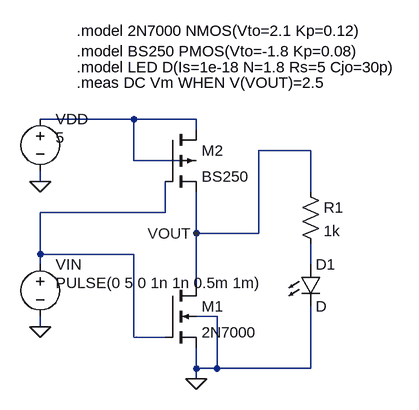
[diagram p0: schematic SPICE SCHEMATIC.asc]
SPICE SCHEMATIC.asc, the LTspice schematic file:
Version 4.1
SHEET 1 948 680
WIRE 160 -336 16 -336
WIRE 256 -336 160 -336
WIRE 256 -320 256 -336
WIRE 432 -288 352 -288
WIRE 160 -272 160 -336
WIRE 256 -272 160 -272
WIRE 16 -240 16 -256
WIRE 432 -224 432 -288
WIRE 208 -192 208 -240
WIRE 208 -192 16 -192
WIRE 256 -160 256 -224
WIRE 352 -160 352 -288
WIRE 352 -160 256 -160
WIRE 16 -128 16 -192
WIRE 160 -128 16 -128
WIRE 16 -112 16 -128
WIRE 432 -112 432 -144
WIRE 256 -80 256 -160
WIRE 288 -32 256 -32
WIRE 16 -16 16 -32
WIRE 160 0 160 -128
WIRE 208 0 160 0
WIRE 256 48 256 16
WIRE 288 48 288 -32
WIRE 288 48 256 48
WIRE 432 48 432 -48
WIRE 432 48 288 48
WIRE 256 64 256 48
FLAG 256 64 0
FLAG 16 -16 0
FLAG 16 -240 0
FLAG 256 -160 VOUT
SYMBOL res 416 -240 R0
SYMATTR InstName R1
SYMATTR Value 1k
SYMBOL voltage 16 -352 R0
WINDOW 3 24 44 Left 2
WINDOW 123 0 0 Left 0
WINDOW 39 0 0 Left 0
SYMATTR Value 5
SYMATTR InstName VDD
SYMBOL LED 416 -112 R0
SYMATTR InstName D1
SYMBOL nmos4 208 -80 R0
SYMATTR InstName M1
SYMATTR Value 2N7000
SYMBOL pmos4 208 -320 R0
SYMATTR InstName M2
SYMATTR Value BS250
SYMBOL voltage 16 -128 R0
WINDOW 3 24 44 Left 2
WINDOW 123 0 0 Left 0
WINDOW 39 0 0 Left 0
SYMATTR Value PULSE(0 5 0 1n 1n 0.5m 1m)
SYMATTR InstName VIN
TEXT 72 -472 Left 2 !.model 2N7000 NMOS(Vto=2.1 Kp=0.12)\n.model BS250 PMOS(Vto=-1.8 Kp=0.08)
TEXT 72 -416 Left 2 !.model LED D(Is=1e-18 N=1.8 Rs=5 Cjo=30p)
TEXT 72 -392 Left 2 !.meas DC Vm WHEN V(VOUT)=2.5

The netlist it stands for:
* SPICE SCHEMATIC.asc
R1 VOUT N003 1k
VDD N001 0 5
D1 N003 0 D
M1 VOUT N002 0 0 2N7000
M2 N001 N002 VOUT N001 BS250
VIN N002 0 PULSE(0 5 0 1n 1n 0.5m 1m)
.model D D
.lib standard.dio
.model NMOS NMOS
.model PMOS PMOS
.lib standard.mos
.model 2N7000 NMOS(Vto=2.1 Kp=0.12)
.model BS250 PMOS(Vto=-1.8 Kp=0.08)
.model LED D(Is=1e-18 N=1.8 Rs=5 Cjo=30p)
.meas DC Vm WHEN V(VOUT)=2.5
.backanno
.end